# Altium schematic sheet Mat_Tren.SchDoc
size A; SheetNumber: 1; SheetTotal: 1
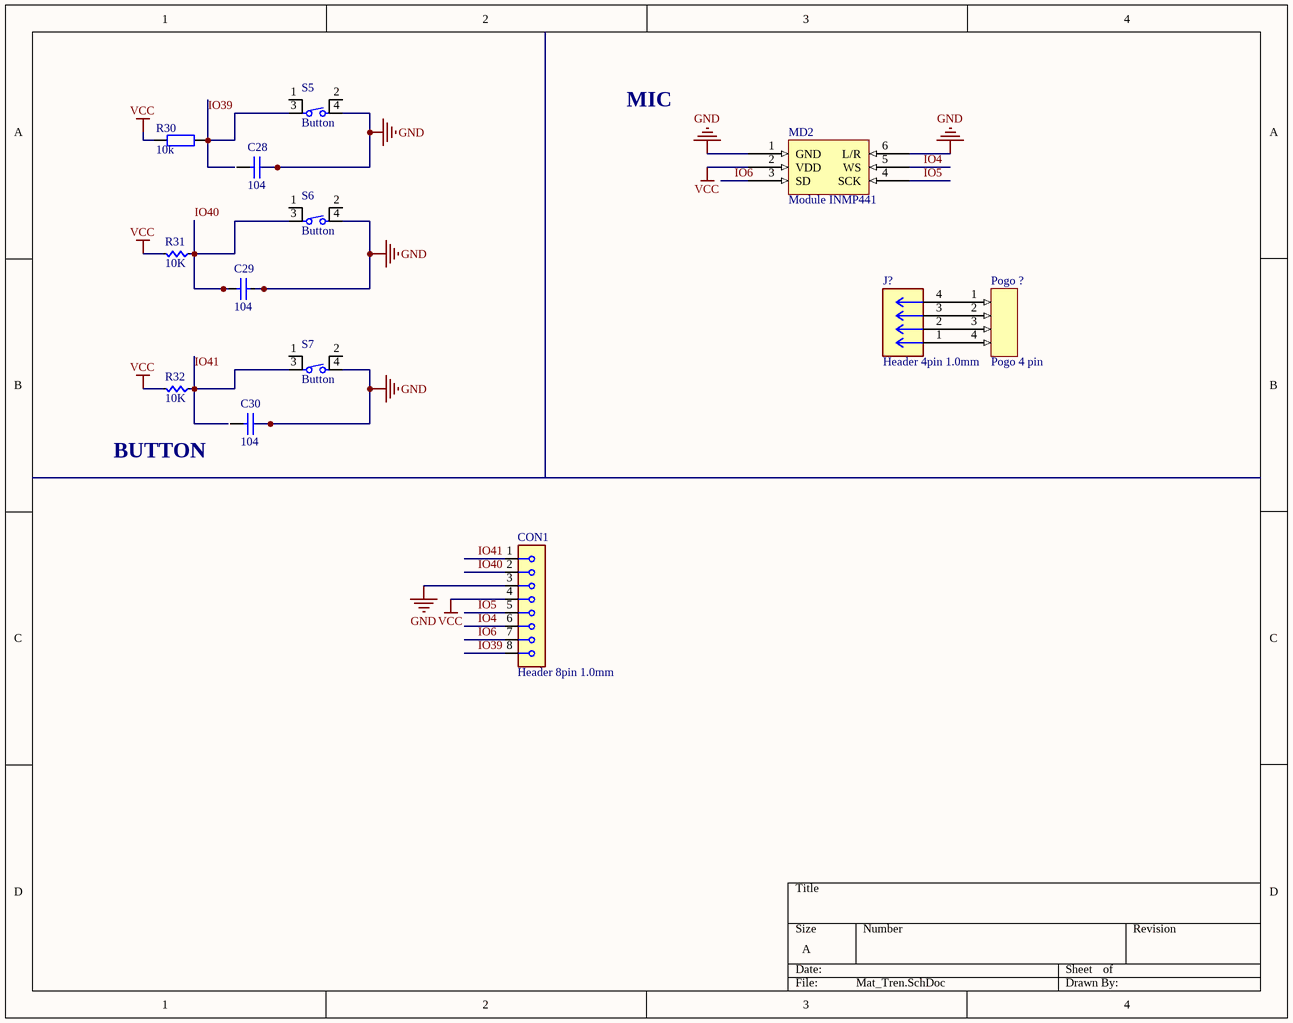
[diagram p0: Mat_Tren.SchDoc]

## Parts
C28  104  [tu 0805]
C29  104  [tu 0805]
C30  104  [tu 0805]
CON1  Header 8pin 1.0mm  [JST_SM08B-SRSS-TB]
J?  Header 4pin 1.0mm  [CONN4_BM04B-SRSS_JST - duplicate]
MD2  Module INMP441  [Module INMP441]
Pogo_?  Pogo 4 pin  [Pogo 4 pin]
R30  10k  [tro smd 0805]
R31  10K  [RES 0805]
R32  10K  [RES 0805]
S5  Button  [SW4-SMD-5.2X5.2X1.5MM]
S6  Button  [SW4-SMD-5.2X5.2X1.5MM]
S7  Button  [SW4-SMD-5.2X5.2X1.5MM]

## Nets
GND: C28.1 C29.1 C30.1 CON1.3 MD2.1(GND) MD2.6(L/R) S5.4 S6.4 S7.4
VCC: CON1.4 MD2.2(VDD) R30.2 R31.2 R32.2
IO4: CON1.6 MD2.5(WS)
IO5: CON1.5 MD2.4(SCK)
IO6: CON1.7 MD2.3(SD)
IO39: CON1.8 R30.1 S5.3
IO40: C29.2 CON1.2 R31.1 S6.3
IO41: CON1.1 R32.1 S7.3
NetJ?_1: J?.1 Pogo_?.4
NetJ?_2: J?.2 Pogo_?.3
NetJ?_3: J?.3 Pogo_?.2
NetJ?_4: J?.4 Pogo_?.1

Not connected (* = marked no-connect by the designer): C28 2; C30 2; S5 1 2(GND1); S6 1 2(GND1); S7 1 2(GND1)

## Notes on the sheet
- MIC
- BUTTON

## Library data of the parts
C28-C30 = Tu 0805 104 50V 10%: Dán; Don_Vi: Con; So_Chan: 2; Ten_Linh_Kien: Tụ 0805 104-100nF 10% 50V; Ma_Hang: MH004551; Chung_Loai: Dán; Kieu_Chan: *
CON1 = Header 8pin 1.0mm: SH Series 8 Position 1 mm Pitch Surface Mount Side Entry Shrouded Header; MF: {'manufacturer': u'JST Sales America Inc.'}; MP: SM08B-SRSS-TB; Package: None; Price: None; Value: *; Availability: Unavailable
J? = Header 4pin 1.0mm: Connector Header Surface Mount, Right Angle 4 position 0.039 (1.00mm); MF: JST Sales; MP: SM04B-SRSS-TB; SnapEDA_Link: https://www.snapeda.com/parts/SM04B-SRSS-TB/JST/view-part/?ref=snap; Package: None; Value: *; Check_prices: https://www.snapeda.com/parts/SM04B-SRSS-TB/JST/view-part/?ref=eda
R30 = Tro 0805 1% 10k: Dán; Don_Vi: Con; So_Chan: 2; Ten_Linh_Kien: Trở 0805 1% 10k; Ma_Hang: MH005473; Chung_Loai: Dán; Kieu_Chan: *
R31 R32 = RES 0805: RES SMD 0805; Manufacturer: Vishay Dale; Manufacturer Part Number: CRCW040210K0FKED; Tolerance: ±1%; Power (Watts): 0.063W, 1/16W; Temperature Coefficient: ±100ppm/°C; Supplier 1: Digi-Key; RoHS: RoHS Compliant; Category: Resistors; Stock 1: 2392462; Pricing 1: 10=0.083, 50=0.0444, 200=0.0255, 1000=0.0174 (USD); Packaging: Cut Tape (CT); Resistance (Ohms): 10k; Composition: Thick Film; Features: Automotive AEC-Q200; Operating Temperature: -55°C ~ 155°C; Package / Case: 0402 (1005 Metric); Supplier Device Package: 0402 (1005 Metric); Size / Dimension: 0.039" L x 0.020" W (1.00mm x 0.50mm); Height: 0.016" (0.40mm); Number of Terminations: 2; ComponentLink1URL: http://www.vishay.com/docs/20035/dcrcwe3.pdf; ComponentLink1Description: http://www.vishay.com/docs/20035/dcrcwe3.pdf; Supplier Part Number 1: 541-10.0KLCT-ND
S5-S7 = Button: Tactile Switch SPST-NO Side Actuated Through Hole, Right Angle; MF: WÃ¼rth Elektronik; MP: 431256058716; SnapEDA_Link: https://www.snapeda.com/parts/431256058716/W%25C3%25BCrth+Elektronik+Midcom/view-part/?ref=snap; Package: None; Value: *; Check_prices: https://www.snapeda.com/parts/431256058716/W%25C3%25BCrth+Elektronik+Midcom/view-part/?ref=eda